# Altium schematic sheet HUSB337-bc911原理图.SchDoc
size 635 x 533 mm
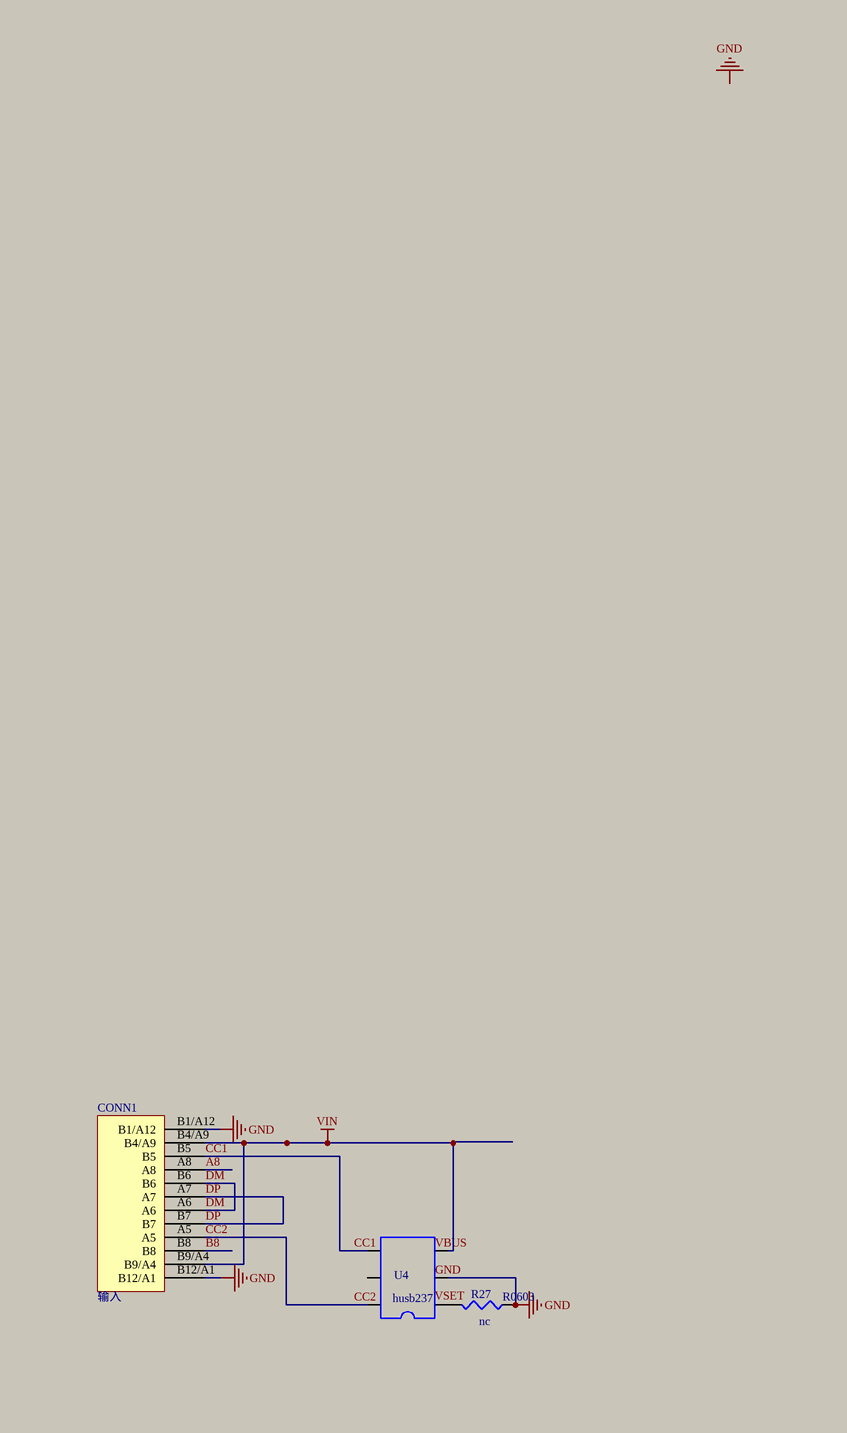
[diagram p0: HUSB337-bc911原理图.SchDoc, top]
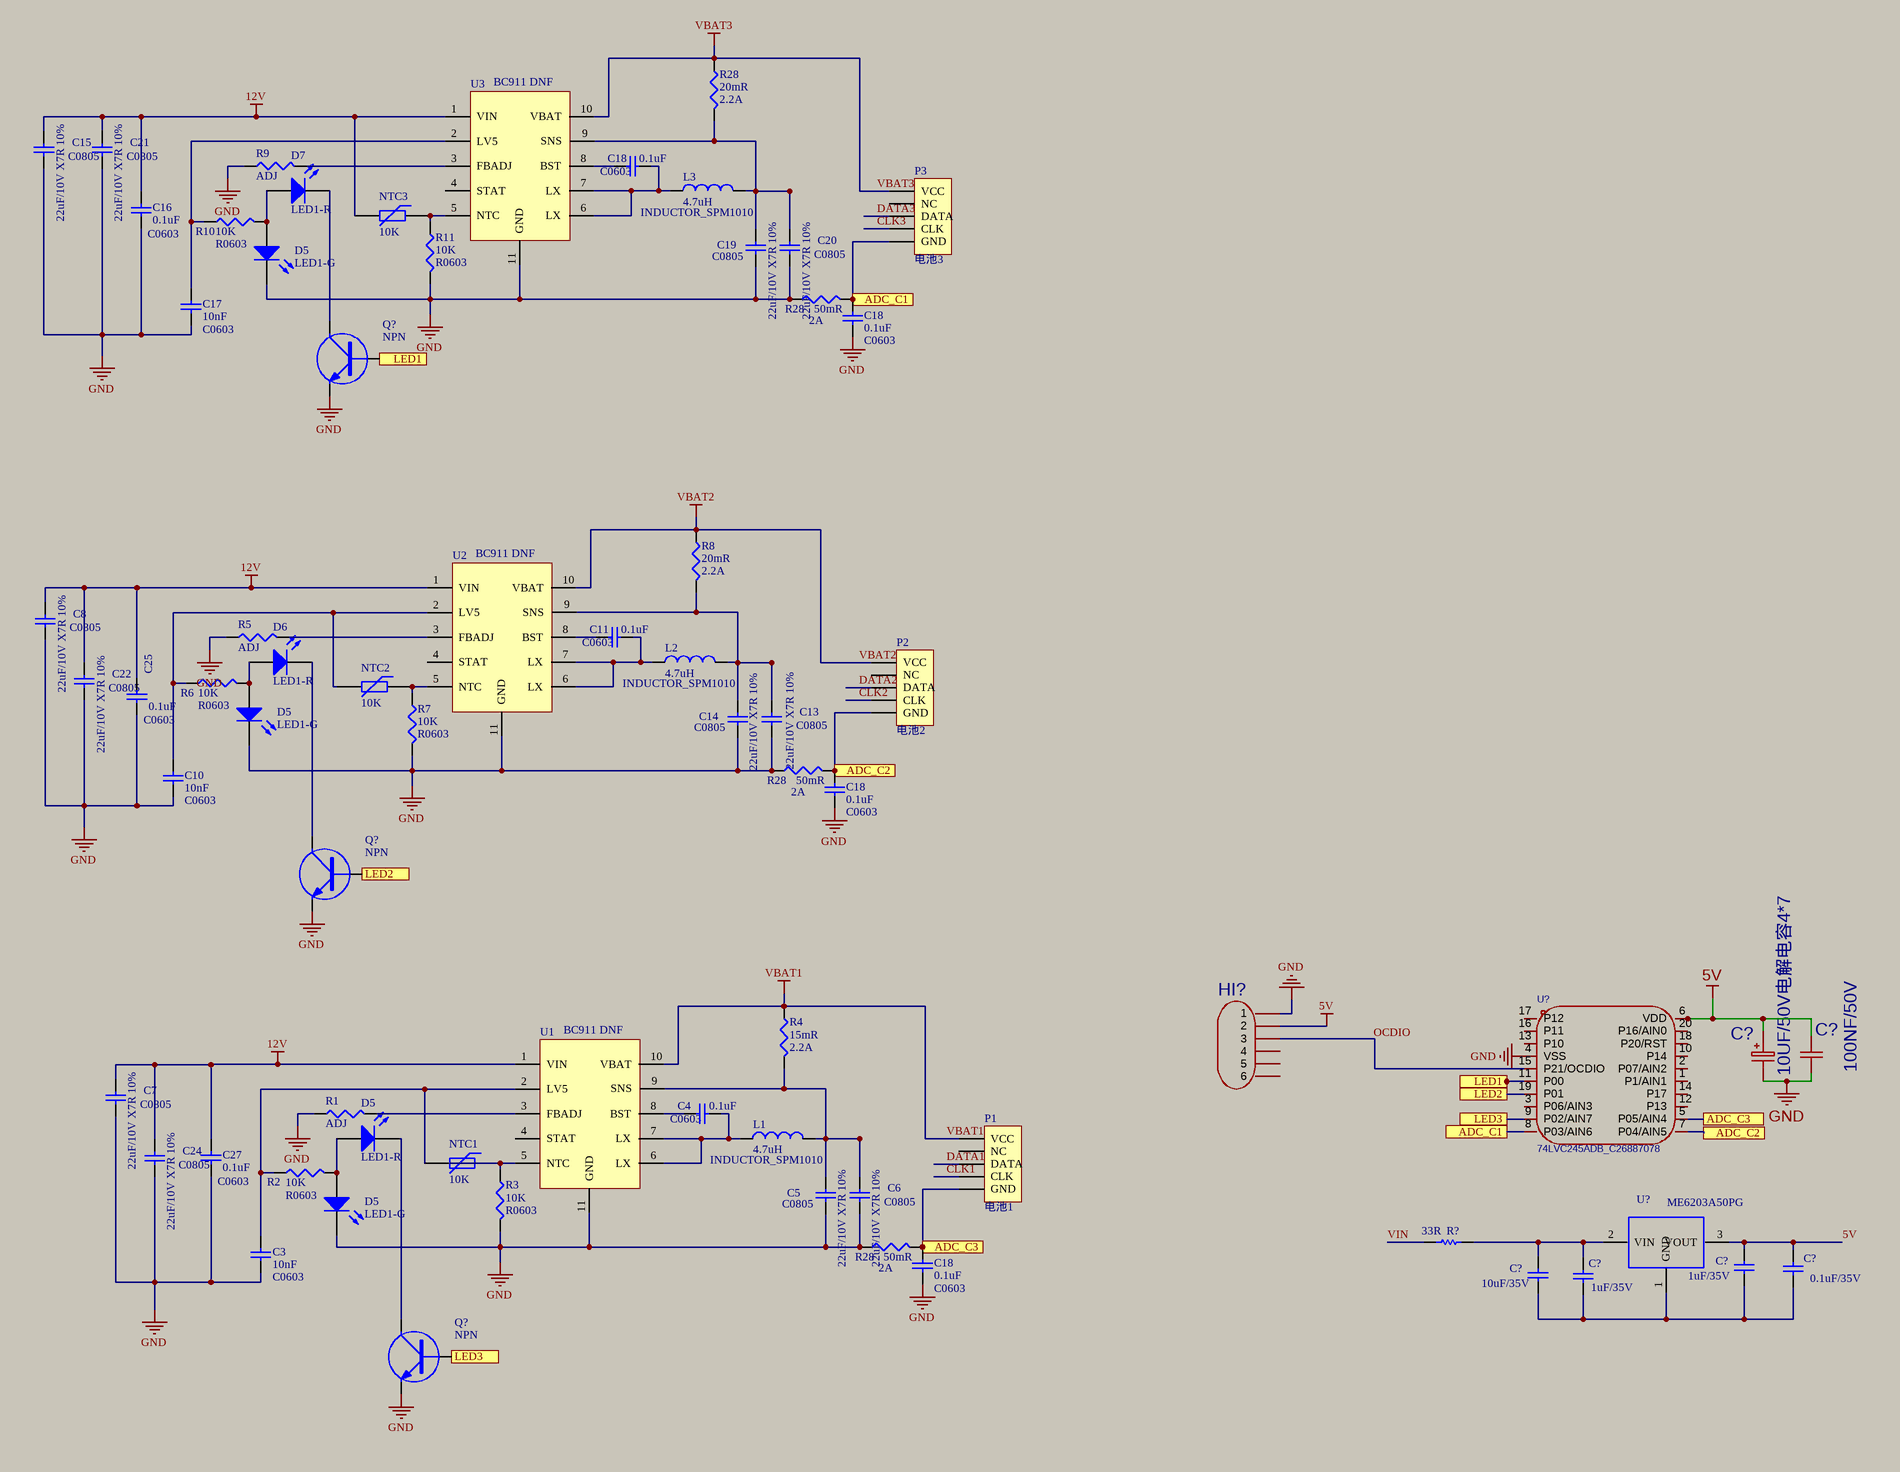
[diagram p1: HUSB337-bc911原理图.SchDoc, bottom]

## Parts
(Parts that share a designator on the sheet are numbered #1, #2 ... from top to bottom, then left to right.)
C3  10nF  value C0603  [0603]
C4  0.1uF  value C0603  [0603]
C5  22uF/10V X7R 10%  value C0805  [SMD-C0805 锡膏]
C6  22uF/10V X7R 10%  value C0805  [SMD-C0805 锡膏]
C7  22uF/10V X7R 10%  value C0805  [SMD-C0805 锡膏]
C8  22uF/10V X7R 10%  value C0805  [SMD-C0805 锡膏]
C10  10nF  value C0603  [SMD-C0805 锡膏]
C11  0.1uF  value C0603  [0603]
C13  22uF/10V X7R 10%  value C0805  [SMD-C0805 锡膏]
C14  22uF/10V X7R 10%  value C0805  [SMD-C0805 锡膏]
C15  22uF/10V X7R 10%  value C0805  [SMD-C0805 锡膏]
C16  0.1uF  value C0603  [0603]
C17  10nF  value C0603  [0603]
C18#1  0.1uF  value C0603  [0603]
C18#2  0.1uF  value C0603  [0603]
C18#3  0.1uF  value C0603  [0603]
C18#4  0.1uF  value C0603  [0603]
C19  22uF/10V X7R 10%  value C0805  [SMD-C0805 锡膏]
C20  22uF/10V X7R 10%  value C0805  [SMD-C0805 锡膏]
C21  22uF/10V X7R 10%  value C0805  [SMD-C0805 锡膏]
C22  22uF/10V X7R 10%  value C0805  [SMD-C0805 锡膏]
C24  22uF/10V X7R 10%  value C0805  [SMD-C0805 锡膏]
C25  0.1uF  value C0603  [0603]
C27  0.1uF  value C0603  [0603]
C?#1  10UF/50V电解电容4*7  [ECAP-6.3*2.5]
C?#2  100NF/50V  [0603]
C?#3  1uF/35V  [C0603]
C?#4  0.1uF/35V  [C0603]
C?#5  10uF/35V  [C1206]
C?#6  1uF/35V  [C0603]
CONN1  输入  [SMD-TYPEC_16Pin 卧式]
D5#1  LED1-G  [3.2X1.6X1.1]
D5#2  LED1-G  [3.2X1.6X1.1]
D5#3  LED1-R  [3.2X1.6X1.1]
D5#4  LED1-G  [3.2X1.6X1.1]
D6  LED1-R  [3.2X1.6X1.1]
D7  LED1-R  [3.2X1.6X1.1]
HI?  (no value)
L1  4.7uH  [SMD-L WHC1040 锡膏]
L2  4.7uH  [SMD-L WHC1040 锡膏]
L3  4.7uH  [SMD-L WHC1040 锡膏]
NTC1  10K  [0603]
NTC2  10K  [0603]
NTC3  10K  [0603]
P1  电池1  [电池座1]
P2  电池2  [电池座1]
P3  电池3  [电池座1]
Q?#1  NPN
Q?#2  NPN
Q?#3  NPN
R1  ADJ  [0603]
R2  10K  Footprint: R0603  [0603]
R3  10K  Footprint: R0603  [0603]
R4  15mR  value 2.2A  [1206]
R5  ADJ  [0603]
R6  10K  Footprint: R0603  [0603]
R7  10K  Footprint: R0603  [0603]
R8  20mR  value 2.2A  [1206]
R9  ADJ  [0603]
R10  10K  Footprint: R0603  [0603]
R11  10K  Footprint: R0603  [0603]
R27  nc  Footprint: R0603  [0603]
R28#1  20mR  value 2.2A  [1206]
R28#2  50mR  value 2A  [1206]
R28#3  50mR  value 2A  [1206]
R28#4  50mR  value 2A  [1206]
R?  33R  [R1206]
U1  BC911 DNF  [DFN33 - 10PIN]
U2  BC911 DNF  [DFN33 - 10PIN]
U3  BC911 DNF  [DFN33 - 10PIN]
U4  husb237  [SOT-23-5]
U?#1  74LVC245ADB_C26887078  [SSOP-20_L7.5-W5.2-P0.65-LS8.0-BL]
U?#2  ME6203A50PG  [SOT89]

## Ports
ADC_C1, ADC_C2, ADC_C3, LED1, LED2, LED3

## Nets
5V: C?#1.1 C?#2.2 C?#3.2 C?#4.2 HI?.2 U?#1.6(VDD) U?#2.3(VOUT)
12V: C7.2 C8.2 C15.2 C16.1 C21.2 C22.2 C24.2 C25.1 C27.1 NTC3.2 U1.1(VIN) U2.1(VIN) U3.1(VIN)
GND: C3.2 C5.1 C6.1 C7.1 C8.1 C10.2 C13.1 C14.1 C15.1 C16.2 C17.2 C18#2.1 C18#3.2 C18#4.2 C19.1 C20.1 C21.1 C22.1 C24.1 C25.2 C27.2 C?#1.2 C?#2.1 CONN1.B1/A12 CONN1.B12/A1 D5#1.2(K) D5#2.2(K) D5#4.2(K) HI?.1 Q?#1.E Q?#2.E Q?#3.E R1.1 R3.2 R5.1 R7.2 R9.1 R11.2 R27.1 R28#2.1 R28#3.1 R28#4.1 U1.11(GND) U2.11(GND) U3.11(GND) U4.2 U?#1.4(VSS)
VBAT1: P1.1(VCC) R4.1 U1.10(VBAT)
VBAT2: P2.1(VCC) R8.1 U2.10(VBAT)
VBAT3: P3.1(VCC) R28#1.1 U3.10(VBAT)
VIN: CONN1.B4/A9 CONN1.B9/A4 R?.2
A8: CONN1.A8
ADC_C1: C18#2.2 P3.5(GND) R28#2.2 U?#1.8(P03/AIN6) ; port ADC_C1
ADC_C2: C18#3.1 P2.5(GND) R28#3.2 U?#1.7(P04/AIN5) ; port ADC_C2
ADC_C3: C18#4.1 P1.5(GND) R28#4.2 U?#1.5(P05/AIN4) ; port ADC_C3
B8: CONN1.B8
CC1: CONN1.B5 U4.4
CC2: CONN1.A5 U4.6
CLK1: P1.4(CLK)
CLK2: P2.4(CLK)
CLK3: P3.4(CLK)
DATA1: P1.3(DATA)
DATA2: P2.3(DATA)
DATA3: P3.3(DATA)
DM: CONN1.A6 CONN1.B6
DP: CONN1.A7 CONN1.B7
LED1: Q?#1.B U?#1.11(P00) ; port LED1
LED2: Q?#2.B U?#1.19(P01) ; port LED2
LED3: Q?#3.B U?#1.9(P02/AIN7) ; port LED3
NetC3_1: C3.1 NTC1.2 R2.1 U1.2(LV5)
NetC4_1: C4.1 U1.8(BST)
NetC4_2: C4.2 L1.1 U1.6(LX) U1.7(LX)
NetC5_2: C5.2 C6.2 L1.2 R4.2 U1.9(SNS)
NetC10_1: C10.1 NTC2.2 R6.1 U2.2(LV5)
NetC11_1: C11.1 U2.8(BST)
NetC11_2: C11.2 L2.1 U2.6(LX) U2.7(LX)
NetC13_2: C13.2 C14.2 L2.2 R8.2 U2.9(SNS)
NetC17_1: C17.1 R10.1 U3.2(LV5)
NetC18#1_1: C18#1.1 U3.8(BST)
NetC18#1_2: C18#1.2 L3.1 U3.6(LX) U3.7(LX)
NetC19_2: C19.2 C20.2 L3.2 R28#1.2 U3.9(SNS)
NetC?#3_1: C?#3.1 C?#4.1 C?#5.1 C?#6.1 U?#2.1(GND)
NetC?#5_2: C?#5.2 C?#6.2 R?.1 U?#2.2(VIN)
NetD5#1_1: D5#1.1(A) D7.1(A) R10.2
NetD5#2_1: D5#2.1(A) D6.1(A) R6.2
NetD5#3_1: D5#3.1(A) D5#4.1(A) R2.2
NetD5#3_2: D5#3.2(K) Q?#3.C
NetD6_2: D6.2(K) Q?#2.C
NetD7_2: D7.2(K) Q?#1.C
NetHI?_3: HI?.3 U?#1.15(P21/OCDIO)
NetNTC1_1: NTC1.1 R3.1 U1.5(NTC)
NetNTC2_1: NTC2.1 R7.1 U2.5(NTC)
NetNTC3_1: NTC3.1 R11.1 U3.5(NTC)
NetR1_2: R1.2 U1.3(FBADJ)
NetR5_2: R5.2 U2.3(FBADJ)
NetR9_2: R9.2 U3.3(FBADJ)
NetR27_2: R27.2 U4.1

Not connected (* = marked no-connect by the designer): HI? 4 5 6; P1 2(NC); P2 2(NC); P3 2(NC); U1 4(STAT); U2 4(STAT); U3 4(STAT); U4 3 5; U?#1 1(P1/AIN1) 2(P07/AIN2) 3(P06/AIN3) 10(P14) 12(P13) 13(P10) 14(P17) 16(P11) 17(P12) 18(P20/RST) 20(P16/AIN0)

## Notes on the sheet
- Labels drawn without touching a wire or pin: GND, OCDIO, VBUS, VSET

## Library data of the parts
C3-C8 C10 C11 C13-C17 C18#1-C18#4 C19-C22 C24 C25 C27 = CAP0603: Capacitor; Published: 8-Jun-2000; LatestRevisionDate: 17-Jul-2002; LatestRevisionNote: Re-released for DXP Platform.; PackageReference: RAD-0.3; Publisher: Altium Limited; PackageDescription: Radial Cap, Thru-Hole; 2 Leads; 0.3 in Pin Spacing
C?#1 = 10UF/50V电解电容4*7: Origin Footprint: 1206; UniqueId: 15f457d0e22dce27; SymbolName: ELECTRO; AddInBom: yes; Device: 10UF/50V电解电容4*7; DesignItemID: ELECTRO; LibraryName: sch; FootprintName: ECAP-6.3*2.5
C?#2 = 100NF/50V: UniqueId: b18536029b1a894b; SymbolName: CAP; AddInBom: yes; ModelId: f6fb33774f7b40b5b4606e3234dba389; Device: 100NF/50V; DesignItemID: CAP; LibraryName: sch; FootprintName: 0603; ModelName: 0603
C?#3-C?#6 = Cap: Capacitor; Value: 100pF; Published: 8-Jun-2000; LatestRevisionDate: 17-Jul-2002; LatestRevisionNote: Re-released for DXP Platform.; PackageReference: RAD-0.3; Publisher: Altium Limited
CONN1 = TYPC C
D5#1-D5#4 D6 D7 = LED2: Typical RED, GREEN, YELLOW, AMBER GaAs LED; Published: 8-Jun-2000; LatestRevisionDate: 17-Jul-2002; LatestRevisionNote: Re-released for DXP Platform.; PackageVersion: Feb-2002; PackageReference: 3.2X1.6X1.1; Publisher: Altium Limited; PackageDescription: SM LED; 2 Flat Leads
HI? = HI6: Header, 6-Pin; Origin Footprint: SIP5; UniqueId: c82c819d53d0542e; SymbolName: Header 6; AddInBom: yes; Device: HI6; LatestRevisionDate: 17-Jul-2002; LatestRevisionNote: Re-released for DXP Platform.; Publisher: Altium Limited; DesignItemID: Header 6; LibraryName: Miscellaneous Connectors
L1-L3 = INDUCTOR_SPM1010: INDUCTOR; Value: 4.7uH; Footprint: INDUCTOR_SPM1010
NTC1-NTC3 = Res Varistor: Varistor (Voltage-Sensitive Resistor); Published: 24-Mar-1999; LatestRevisionDate: 29-May-2009; LatestRevisionNote: IPC-7351 Footprint Added.; PackageVersion: Mar-2003; PackageReference: 6-0805; Publisher: 10K; PackageDescription: Chip Resistor 0805 Case Size; Code_IPC: RESC2012
P1-P3 = Header 5: Header, 5-Pin; LatestRevisionDate: 17-Jul-2002; LatestRevisionNote: Re-released for DXP Platform.; Publisher: Altium Limited
R1 R5 R9 = RES_0603: Resistor; Value: 10K; Footprint: R0603
R2 R4 R6 R8 R10 R28#1-R28#4 = RES_0603: Resistor
  R2 R6 R10: Value: 10K
  R4 R8 R28#1-R28#4: Footprint: R1206
R3 R7 R11 R27 = RES_0603: Resistor; Value: 27K
R? = Res1: Resistor; Value: 33R/1206; Published: 8-Jun-2000; LatestRevisionDate: 17-Jul-2002; LatestRevisionNote: Re-released for DXP Platform.; PackageReference: AXIAL-0.3; Publisher: Altium Limited
U4 = IC-6
U?#1 = 74LVC245ADB_C26887078: AddInBom: yes; Device: 74LVC245ADB_C26887078; DesignItemID: 74LVC245ADB_C26887078; LibraryName: 74LVC245ADB_C26887078_2026-07-04; Symbol: 74LVC245ADB_C26887078; FootprintName: SSOP-20_L7.5-W5.2-P0.65-LS8.0-BL
U?#2 = LDO-7550: PCB DECAL: LC-SOT-89(SOT-89-3)